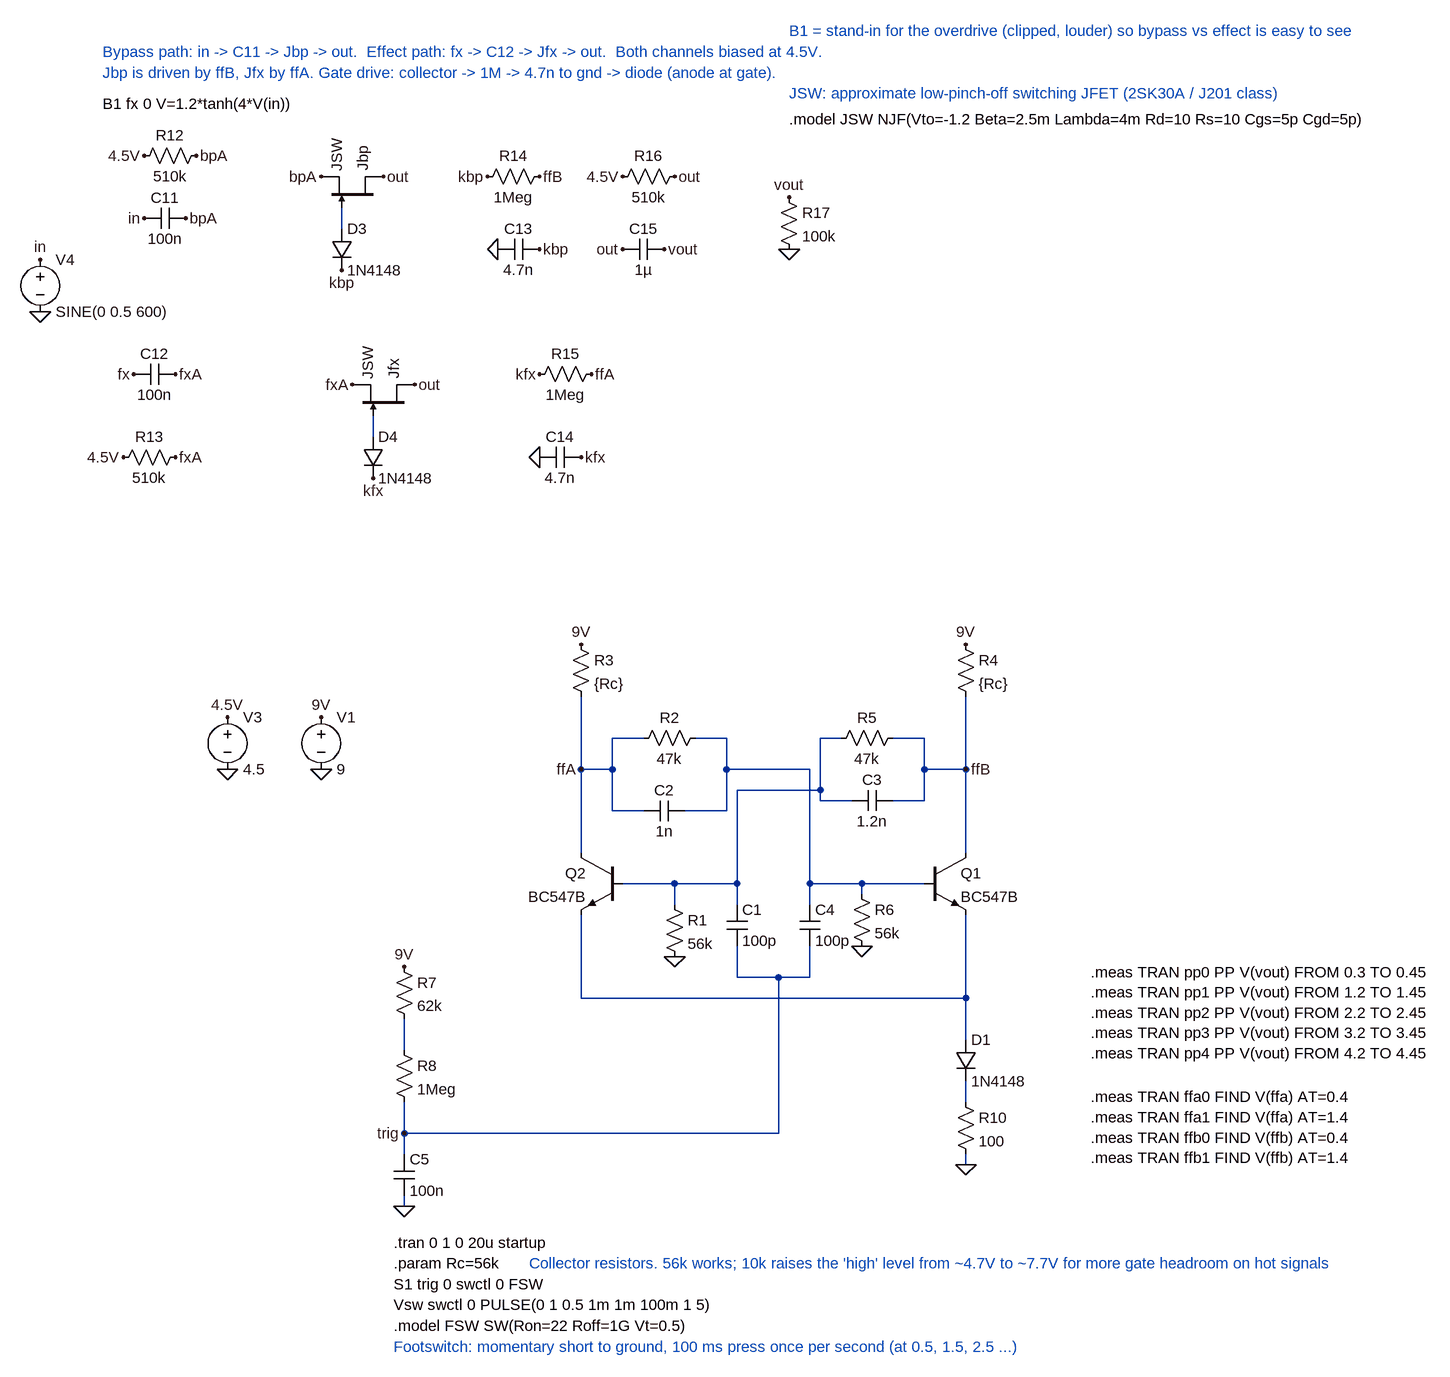
[diagram p0: schematic Toggle Circuit.asc]
Toggle Circuit.asc, the LTspice schematic file:
Version 4.1
SHEET 1 1324 1200
WIRE -368 -896 -368 -928
WIRE -320 -576 -320 -608
WIRE 96 -112 48 -112
WIRE 224 -112 176 -112
WIRE 400 -112 368 -112
WIRE 528 -112 480 -112
WIRE 0 -64 0 -176
WIRE 48 -64 48 -112
WIRE 48 -64 0 -64
WIRE 224 -64 224 -112
WIRE 352 -64 224 -64
WIRE 528 -64 528 -112
WIRE 592 -64 592 -176
WIRE 592 -64 528 -64
WIRE 368 -32 368 -112
WIRE 368 -32 240 -32
WIRE 368 -16 368 -32
WIRE 416 -16 368 -16
WIRE 528 -16 528 -64
WIRE 528 -16 480 -16
WIRE 48 0 48 -64
WIRE 96 0 48 0
WIRE 224 0 224 -64
WIRE 224 0 160 0
WIRE 0 64 0 -64
WIRE 592 64 592 -64
WIRE 144 112 64 112
WIRE 240 112 240 -32
WIRE 240 112 144 112
WIRE 352 112 352 -64
WIRE 432 112 352 112
WIRE 528 112 432 112
WIRE 432 128 432 112
WIRE 144 144 144 112
WIRE 240 144 240 112
WIRE 352 144 352 112
WIRE 240 256 240 208
WIRE 304 256 240 256
WIRE 352 256 352 208
WIRE 352 256 304 256
WIRE 0 288 0 160
WIRE 592 288 592 160
WIRE 592 288 0 288
WIRE 592 352 592 288
WIRE -272 368 -272 320
WIRE 592 448 592 416
WIRE -272 496 -272 448
WIRE 304 496 304 256
WIRE 304 496 -272 496
WIRE -272 528 -272 496
WIRE 592 544 592 528
WIRE -272 608 -272 592
FLAG 144 224 0
FLAG 432 208 0
FLAG -400 -64 0
FLAG -400 -144 9V
FLAG 0 -256 9V
FLAG 592 -256 9V
FLAG -272 240 9V
FLAG 592 544 0
FLAG -272 608 0
FLAG -544 -64 0
FLAG -544 -144 4.5V
FLAG -272 496 trig
FLAG 0 -64 ffA
FLAG 592 -64 ffB
FLAG -832 -848 in
FLAG -832 -768 0
FLAG -672 -912 in
FLAG -608 -912 bpA
FLAG -688 -672 fx
FLAG -624 -672 fxA
FLAG -592 -1008 bpA
FLAG -672 -1008 4.5V
FLAG -624 -544 fxA
FLAG -704 -544 4.5V
FLAG -400 -976 bpA
FLAG -304 -976 out
FLAG -352 -656 fxA
FLAG -256 -656 out
FLAG -368 -832 kbp
FLAG -320 -512 kfx
FLAG -64 -976 ffB
FLAG -144 -976 kbp
FLAG -64 -864 kbp
FLAG -128 -864 0
FLAG 16 -672 ffA
FLAG -64 -672 kfx
FLAG 0 -544 kfx
FLAG -64 -544 0
FLAG 144 -976 out
FLAG 64 -976 4.5V
FLAG 64 -864 out
FLAG 128 -864 vout
FLAG 320 -944 vout
FLAG 320 -864 0
SYMBOL npn 528 64 R0
SYMATTR InstName Q1
SYMATTR Value BC547B
SYMBOL npn 64 64 M0
SYMATTR InstName Q2
SYMATTR Value BC547B
SYMBOL res 128 128 R0
SYMATTR InstName R1
SYMATTR Value 56k
SYMBOL cap 224 144 R0
SYMATTR InstName C1
SYMATTR Value 100p
SYMBOL cap 160 -16 R90
WINDOW 0 0 32 VBottom 2
WINDOW 3 32 32 VTop 2
SYMATTR InstName C2
SYMATTR Value 1n
SYMBOL res 192 -128 R90
WINDOW 0 0 56 VBottom 2
WINDOW 3 32 56 VTop 2
SYMATTR InstName R2
SYMATTR Value 47k
SYMBOL res -16 -272 R0
SYMATTR InstName R3
SYMATTR Value {Rc}
SYMBOL res 576 -272 R0
SYMATTR InstName R4
SYMATTR Value {Rc}
SYMBOL res 496 -128 R90
WINDOW 0 0 56 VBottom 2
WINDOW 3 32 56 VTop 2
SYMATTR InstName R5
SYMATTR Value 47k
SYMBOL cap 480 -32 R90
WINDOW 0 0 32 VBottom 2
WINDOW 3 32 32 VTop 2
SYMATTR InstName C3
SYMATTR Value 1.2n
SYMBOL cap 336 144 R0
SYMATTR InstName C4
SYMATTR Value 100p
SYMBOL res 416 112 R0
SYMATTR InstName R6
SYMATTR Value 56k
SYMBOL voltage -400 -160 R0
SYMATTR InstName V1
SYMATTR Value 9
SYMBOL res -288 224 R0
SYMATTR InstName R7
SYMATTR Value 62k
SYMBOL res -288 352 R0
SYMATTR InstName R8
SYMATTR Value 1Meg
SYMBOL diode 576 352 R0
SYMATTR InstName D1
SYMATTR Value 1N4148
SYMBOL res 576 432 R0
SYMATTR InstName R10
SYMATTR Value 100
SYMBOL cap -288 528 R0
SYMATTR InstName C5
SYMATTR Value 100n
SYMBOL voltage -544 -160 R0
SYMATTR InstName V3
SYMATTR Value 4.5
SYMBOL voltage -832 -864 R0
WINDOW 123 0 0 Left 0
WINDOW 39 0 0 Left 0
SYMATTR InstName V4
SYMATTR Value SINE(0 0.5 600)
SYMBOL cap -608 -928 R90
WINDOW 0 0 32 VBottom 2
WINDOW 3 32 32 VTop 2
SYMATTR InstName C11
SYMATTR Value 100n
SYMBOL cap -624 -688 R90
WINDOW 0 0 32 VBottom 2
WINDOW 3 32 32 VTop 2
SYMATTR InstName C12
SYMATTR Value 100n
SYMBOL res -576 -1024 R90
WINDOW 0 0 56 VBottom 2
WINDOW 3 32 56 VTop 2
SYMATTR InstName R12
SYMATTR Value 510k
SYMBOL res -608 -560 R90
WINDOW 0 0 56 VBottom 2
WINDOW 3 32 56 VTop 2
SYMATTR InstName R13
SYMATTR Value 510k
SYMBOL njf -304 -928 M270
SYMATTR InstName Jbp
SYMATTR Value JSW
SYMBOL njf -256 -608 M270
SYMATTR InstName Jfx
SYMATTR Value JSW
SYMBOL diode -384 -896 R0
SYMATTR InstName D3
SYMATTR Value 1N4148
SYMBOL diode -336 -576 R0
SYMATTR InstName D4
SYMATTR Value 1N4148
SYMBOL res -48 -992 R90
WINDOW 0 0 56 VBottom 2
WINDOW 3 32 56 VTop 2
SYMATTR InstName R14
SYMATTR Value 1Meg
SYMBOL cap -64 -880 R90
WINDOW 0 0 32 VBottom 2
WINDOW 3 32 32 VTop 2
SYMATTR InstName C13
SYMATTR Value 4.7n
SYMBOL res 32 -688 R90
WINDOW 0 0 56 VBottom 2
WINDOW 3 32 56 VTop 2
SYMATTR InstName R15
SYMATTR Value 1Meg
SYMBOL cap 0 -560 R90
WINDOW 0 0 32 VBottom 2
WINDOW 3 32 32 VTop 2
SYMATTR InstName C14
SYMATTR Value 4.7n
SYMBOL res 160 -992 R90
WINDOW 0 0 56 VBottom 2
WINDOW 3 32 56 VTop 2
SYMATTR InstName R16
SYMATTR Value 510k
SYMBOL cap 128 -880 R90
WINDOW 0 0 32 VBottom 2
WINDOW 3 32 32 VTop 2
SYMATTR InstName C15
SYMATTR Value 1µ
SYMBOL res 304 -960 R0
SYMATTR InstName R17
SYMATTR Value 100k
TEXT -736 -1168 Left 2 ;Bypass path: in -> C11 -> Jbp -> out.  Effect path: fx -> C12 -> Jfx -> out.  Both channels biased at 4.5V.
TEXT -736 -1136 Left 2 ;Jbp is driven by ffB, Jfx by ffA. Gate drive: collector -> 1M -> 4.7n to gnd -> diode (anode at gate).
TEXT -736 -1088 Left 2 !B1 fx 0 V=1.2*tanh(4*V(in))
TEXT 320 -1200 Left 2 ;B1 = stand-in for the overdrive (clipped, louder) so bypass vs effect is easy to see
TEXT 320 -1064 Left 2 !.model JSW NJF(Vto=-1.2 Beta=2.5m Lambda=4m Rd=10 Rs=10 Cgs=5p Cgd=5p)
TEXT 320 -1104 Left 2 ;JSW: approximate low-pinch-off switching JFET (2SK30A / J201 class)
TEXT -288 664 Left 2 !.tran 0 1 0 20u startup
TEXT -288 696 Left 2 !.param Rc=56k
TEXT -80 696 Left 2 ;Collector resistors. 56k works; 10k raises the 'high' level from ~4.7V to ~7.7V for more gate headroom on hot signals
TEXT -288 728 Left 2 !S1 trig 0 swctl 0 FSW
TEXT -288 760 Left 2 !Vsw swctl 0 PULSE(0 1 0.5 1m 1m 100m 1 5)
TEXT -288 792 Left 2 !.model FSW SW(Ron=22 Roff=1G Vt=0.5)
TEXT -288 824 Left 2 ;Footswitch: momentary short to ground, 100 ms press once per second (at 0.5, 1.5, 2.5 ...)
TEXT 784 248 Left 2 !.meas TRAN pp0 PP V(vout) FROM 0.3 TO 0.45\n.meas TRAN pp1 PP V(vout) FROM 1.2 TO 1.45\n.meas TRAN pp2 PP V(vout) FROM 2.2 TO 2.45\n.meas TRAN pp3 PP V(vout) FROM 3.2 TO 3.45\n.meas TRAN pp4 PP V(vout) FROM 4.2 TO 4.45
TEXT 784 440 Left 2 !.meas TRAN ffa0 FIND V(ffa) AT=0.4\n.meas TRAN ffa1 FIND V(ffa) AT=1.4\n.meas TRAN ffb0 FIND V(ffb) AT=0.4\n.meas TRAN ffb1 FIND V(ffb) AT=1.4

The netlist it stands for:
* Toggle Circuit.asc
Q1 ffB N003 N005 0 BC547B
Q2 ffA N004 N005 0 BC547B
R1 N004 0 56k
C1 N004 trig 100p
C2 N003 ffA 1n
R2 N003 ffA 47k
R3 9V ffA {Rc}
R4 9V ffB {Rc}
R5 ffB N004 47k
C3 ffB N004 1.2n
C4 N003 trig 100p
R6 N003 0 56k
V1 9V 0 9
R7 9V N006 62k
R8 N006 trig 1Meg
D1 N005 N007 1N4148
R10 N007 0 100
C5 trig 0 100n
V3 4.5V 0 4.5
V4 in 0 SINE(0 0.5 600)
C11 bpA in 100n
C12 fxA fx 100n
R12 bpA 4.5V 510k
R13 fxA 4.5V 510k
Jbp out N001 bpA JSW
Jfx out N002 fxA JSW
D3 N001 kbp 1N4148
D4 N002 kfx 1N4148
R14 ffB kbp 1Meg
C13 kbp 0 4.7n
R15 ffA kfx 1Meg
C14 kfx 0 4.7n
R16 out 4.5V 510k
C15 vout out 1µ
R17 vout 0 100k
.model D D
.lib standard.dio
.model NPN NPN
.model PNP PNP
.lib standard.bjt
.model NJF NJF
.model PJF PJF
.lib standard.jft
* Bypass path: in -> C11 -> Jbp -> out.  Effect path: fx -> C12 -> Jfx -> out.  Both channels biased at 4.5V.
* Jbp is driven by ffB, Jfx by ffA. Gate drive: collector -> 1M -> 4.7n to gnd -> diode (anode at gate).
B1 fx 0 V=1.2*tanh(4*V(in))
* B1 = stand-in for the overdrive (clipped, louder) so bypass vs effect is easy to see
.model JSW NJF(Vto=-1.2 Beta=2.5m Lambda=4m Rd=10 Rs=10 Cgs=5p Cgd=5p)
* JSW: approximate low-pinch-off switching JFET (2SK30A / J201 class)
.tran 0 1 0 20u startup
.param Rc=56k
* Collector resistors. 56k works; 10k raises the 'high' level from ~4.7V to ~7.7V for more gate headroom on hot signals
S1 trig 0 swctl 0 FSW
Vsw swctl 0 PULSE(0 1 0.5 1m 1m 100m 1 5)
.model FSW SW(Ron=22 Roff=1G Vt=0.5)
* Footswitch: momentary short to ground, 100 ms press once per second (at 0.5, 1.5, 2.5 ...)
.meas TRAN pp0 PP V(vout) FROM 0.3 TO 0.45
.meas TRAN pp1 PP V(vout) FROM 1.2 TO 1.45
.meas TRAN pp2 PP V(vout) FROM 2.2 TO 2.45
.meas TRAN pp3 PP V(vout) FROM 3.2 TO 3.45
.meas TRAN pp4 PP V(vout) FROM 4.2 TO 4.45
.meas TRAN ffa0 FIND V(ffa) AT=0.4
.meas TRAN ffa1 FIND V(ffa) AT=1.4
.meas TRAN ffb0 FIND V(ffb) AT=0.4
.meas TRAN ffb1 FIND V(ffb) AT=1.4
.backanno
.end